# EasyEDA Pro project ProPrj_ROV_MINI_CTRL_2026-11-13.epro, board ROV_MINI_CTRL_V1.0.0
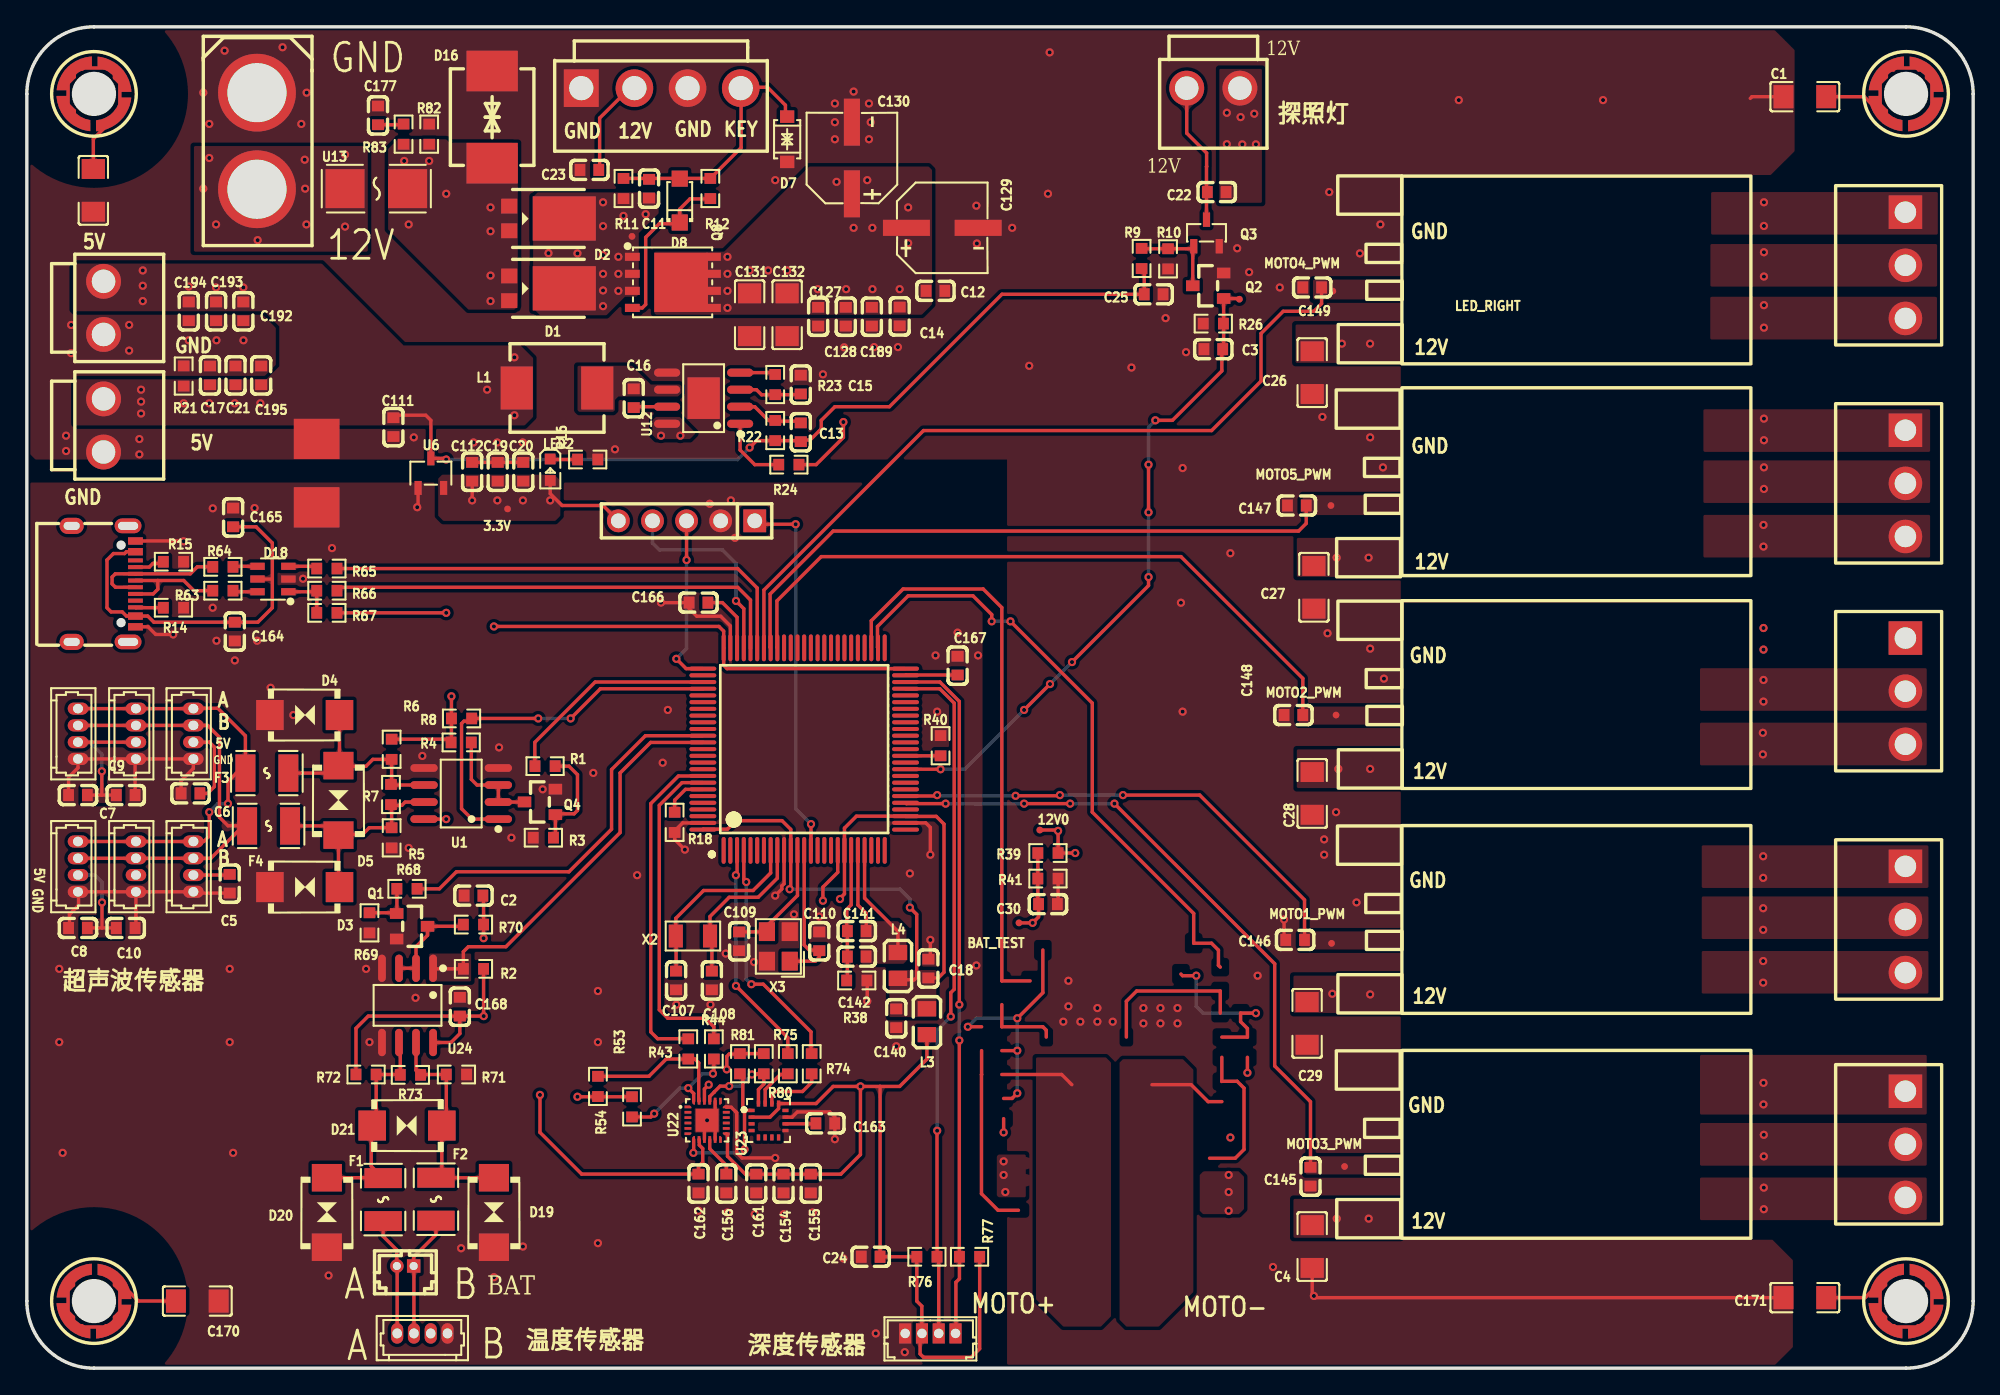
[diagram p12: board, top side]
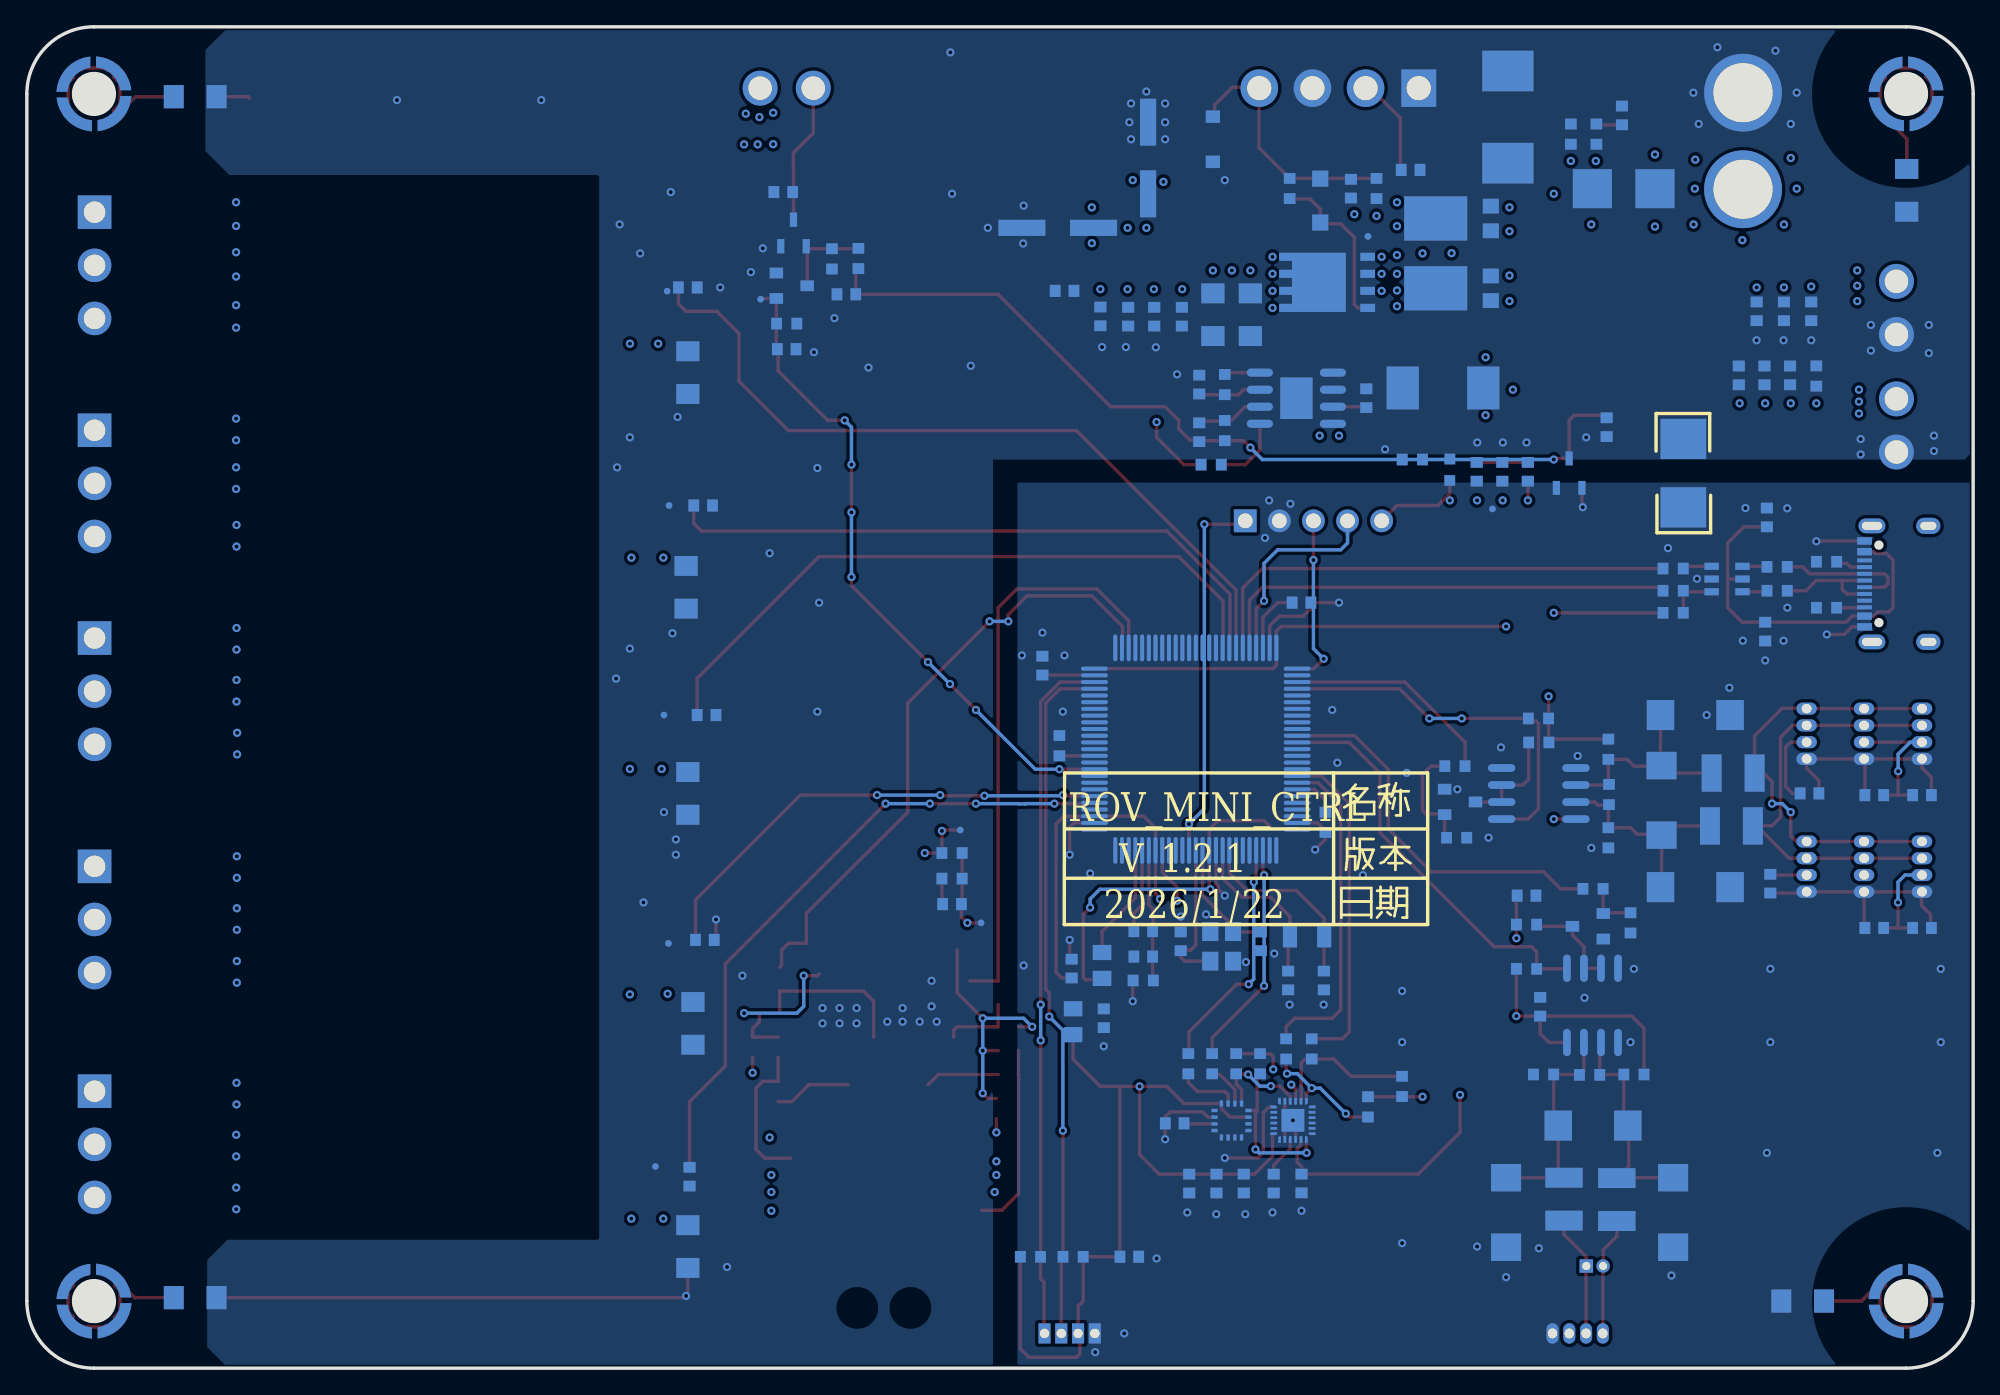
[diagram p13: board, bottom side, seen from below]

Outline 145 x 100 mm; copper layers: Top Layer, Inner1, Inner2, Bottom Layer. Coordinates in mm from the lower left corner of the outline.
Outline path: 0,95 0,5 arc(1.46,1.46) 5,0 140,0 arc(143.54,1.46) 145,5 145,95 arc(143.54,98.54) 140,100 5,100 arc(1.46,98.54) 0,95
Stack: Top Layer 0.035mm 外层铜厚1oz / Dielectric1 0.2104mm 7628 RC49% 8.6mil / Inner1 0.0152mm 内层铜厚 / Dielectric2 1.065mm 1.1mm H/HOZ Copper / Inner2 0.0152mm 内层铜厚 / Dielectric3 0.2104mm 7628 RC49% 8.6mil / Bottom Layer 0.035mm 外层铜厚1oz

## Design rules (mm)
spacing copperThickness1oz (default): track to track 0.102, other pairs 0.152 to 0.3
spacing copperThickness2oz: track to track 0.203, other pairs 0.152 to 0.3
spacing Plane_innerPlane: track to track 0.102, other pairs 0.152 to 0.3
spacing Copper_copperRegion: track to track 0.102, other pairs 0.152 to 0.3
track width copperThickness1oz (default): min 0.127, default 0.254, max 2.54
track width copperThickness2oz: min 0.203, default 0.254, max 2.54
differential pair differentialPair (default): width min 0.127, default 0.254, max 2.54; gap min 0.152, default 0.152
net class GND uses Copper_copperRegion, Plane_innerPlane
net 3V3 uses Copper_copperRegion, Plane_innerPlane
net 5V0 uses Copper_copperRegion, Plane_innerPlane
net 12V0_IN uses Copper_copperRegion, Plane_innerPlane
net GND uses Copper_copperRegion, Plane_innerPlane
net 3V3_MCU uses Copper_copperRegion, Plane_innerPlane
net $3N697 uses Copper_copperRegion, Plane_innerPlane
net $3N698 uses Copper_copperRegion, Plane_innerPlane
net $3N900 uses Copper_copperRegion, Plane_innerPlane
net $3N913 uses Copper_copperRegion, Plane_innerPlane
net MOTO1_PWM_TIM3_CH1 uses Copper_copperRegion, Plane_innerPlane
net MOTO3_PWM_TIM2_CH1 uses Copper_copperRegion, Plane_innerPlane
net NRST uses Copper_copperRegion, Plane_innerPlane
net SWCLK uses Copper_copperRegion, Plane_innerPlane
net SWDIO uses Copper_copperRegion, Plane_innerPlane
net PB5 uses Copper_copperRegion, Plane_innerPlane
net $3N1102 uses Copper_copperRegion, Plane_innerPlane
net IMU_I2C1_SCL uses Copper_copperRegion, Plane_innerPlane
net IMU_I2C1_SDA uses Copper_copperRegion, Plane_innerPlane
net VDDA uses Copper_copperRegion, Plane_innerPlane
net $3N27755 uses Copper_copperRegion, Plane_innerPlane
net $3N37958 uses Copper_copperRegion, Plane_innerPlane
net $3N37962 uses Copper_copperRegion, Plane_innerPlane
net PD6_UART2_RX_BAT uses Copper_copperRegion, Plane_innerPlane
net PD5_UART2_TX_BAT uses Copper_copperRegion, Plane_innerPlane
net $3N43765 uses Copper_copperRegion, Plane_innerPlane
net OTG_FS_DP uses Copper_copperRegion, Plane_innerPlane
net OTG_FS_DM uses Copper_copperRegion, Plane_innerPlane
net MOTO5_PWM_TIM1_CH2 uses Copper_copperRegion, Plane_innerPlane
net MOTO2_PWM_TIM1_CH1 uses Copper_copperRegion, Plane_innerPlane
net RSTN uses Copper_copperRegion, Plane_innerPlane
net DRDY uses Copper_copperRegion, Plane_innerPlane
net $3N43824 uses Copper_copperRegion, Plane_innerPlane
net $3N37466 uses Copper_copperRegion, Plane_innerPlane
net $7N447 uses Copper_copperRegion, Plane_innerPlane
net $7N1099 uses Copper_copperRegion, Plane_innerPlane
net 5VUSB uses Copper_copperRegion, Plane_innerPlane
net BAT_A uses Copper_copperRegion, Plane_innerPlane
net BAT_B uses Copper_copperRegion, Plane_innerPlane
net $5N5769 uses Copper_copperRegion, Plane_innerPlane
net $5N5773 uses Copper_copperRegion, Plane_innerPlane
net $5N5566 uses Copper_copperRegion, Plane_innerPlane
net $5N5491 uses Copper_copperRegion, Plane_innerPlane
net $6N1333 uses Copper_copperRegion, Plane_innerPlane
net $6N1784 uses Copper_copperRegion, Plane_innerPlane
net $6N582 uses Copper_copperRegion, Plane_innerPlane
net $6N719 uses Copper_copperRegion, Plane_innerPlane
net $5N2875 uses Copper_copperRegion, Plane_innerPlane
net $5N2878 uses Copper_copperRegion, Plane_innerPlane
net $7N2109 uses Copper_copperRegion, Plane_innerPlane
net $7N2149 uses Copper_copperRegion, Plane_innerPlane
net AUX_DA uses Copper_copperRegion, Plane_innerPlane
net AUX_CL uses Copper_copperRegion, Plane_innerPlane
net $6N3154 uses Copper_copperRegion, Plane_innerPlane
net $6N3161 uses Copper_copperRegion, Plane_innerPlane
net $6N3166 uses Copper_copperRegion, Plane_innerPlane
net I2C2_SDA uses Copper_copperRegion, Plane_innerPlane
net I2C2_SCL uses Copper_copperRegion, Plane_innerPlane
net $8N1202 uses Copper_copperRegion, Plane_innerPlane
net $8N1351 uses Copper_copperRegion, Plane_innerPlane
net $8N1499 uses Copper_copperRegion, Plane_innerPlane
net $8N1306 uses Copper_copperRegion, Plane_innerPlane
net $9N50407 uses copperRegion_copperThickness1oz
net $9N50406 uses copperRegion_copperThickness1oz
net 12V0 uses copperRegion_copperThickness1oz
net $9N50416 uses copperRegion_copperThickness1oz
pour e645 uses Copper_copperRegion, copperRegion_Copper_copperRegion
pour e647 uses Copper_copperRegion, copperRegion_Copper_copperRegion
pour e679 uses Copper_copperRegion, copperRegion_Copper_copperRegion
pour e681 uses Copper_copperRegion, copperRegion_Copper_copperRegion
pour e683 uses Copper_copperRegion, copperRegion_Copper_copperRegion
pour e685 uses Copper_copperRegion, copperRegion_Copper_copperRegion
pour e719 uses Copper_copperRegion, copperRegion_Copper_copperRegion
pour e721 uses Copper_copperRegion, copperRegion_Copper_copperRegion
pour e723 uses Copper_copperRegion, copperRegion_Copper_copperRegion
pour e725 uses Copper_copperRegion, copperRegion_Copper_copperRegion
pour e727 uses Copper_copperRegion, copperRegion_Copper_copperRegion
pour e729 uses Copper_copperRegion, copperRegion_Copper_copperRegion
pour e733 uses Copper_copperRegion, copperRegion_Copper_copperRegion
net MOTO+ uses copperRegion_copperThickness1oz
net MOTO- uses copperRegion_copperThickness1oz
pour e1003 uses Copper_copperRegion, copperRegion_Copper_copperRegion
pour e1011 uses Copper_copperRegion, copperRegion_Copper_copperRegion
pour e1151 uses Copper_copperRegion, copperRegion_Copper_copperRegion
net SENSOR_B uses copperRegion_copperThickness1oz
pour e1418 uses Copper_copperRegion, copperRegion_Copper_copperRegion
pour e1420 uses Copper_copperRegion, copperRegion_Copper_copperRegion
pour e1596 uses Copper_copperRegion, copperRegion_Copper_copperRegion
pour e1953 uses Copper_copperRegion, copperRegion_Copper_copperRegion
pour e1981 uses Copper_copperRegion, copperRegion_Copper_copperRegion
pour e2005 uses Copper_copperRegion, copperRegion_Copper_copperRegion
pour e2120 uses Copper_copperRegion, copperRegion_Copper_copperRegion
pour e2124 uses Copper_copperRegion, copperRegion_Copper_copperRegion
pour e2153 uses Copper_copperRegion, copperRegion_Copper_copperRegion
pour e2157 uses Copper_copperRegion, copperRegion_Copper_copperRegion
pour e2159 uses Copper_copperRegion, copperRegion_Copper_copperRegion
pour e2161 uses Copper_copperRegion, copperRegion_Copper_copperRegion
pour e2189 uses Copper_copperRegion, copperRegion_Copper_copperRegion
pour e2218 uses Copper_copperRegion, copperRegion_Copper_copperRegion

## Placement (name value [footprint] x y rotation side)
3.3V  -  [Test-Point-0.5mm]  35.81 64.06 270 top
12V0  -  [Test-Point-0.5mm]  75.46 40.12 0 top
12V0_IN  -  [Test-Point-0.5mm]  45.08 84.38 0 top
BAT_TEST  -  [Test-Point-0.5mm]  73.91 33.2 0 top
C1  1nF  [C1206]  132.46 94.79 0 top
C2  100nF  [C0603]  33.27 35.23 0 top
C3  100nF  [C0603]  88.39 75.97 0 top
C4  22uF  [C1206]  95.76 9.07 90 top
C5  100nF  [C0603]  15.11 36.12 90 top
C6  100nF  [C0603]  12.19 42.85 0 top
C7  100nF  [C0603]  3.81 42.72 0 top
C8  100nF  [C0603]  3.81 32.82 0 top
C9  100nF  [C0603]  7.37 42.72 180 top
C10  100nF  [C0603]  7.37 32.82 180 top
C11  100nF  [C0603]  46.36 87.94 270 top
C12  10uF  [C0603]  67.69 80.31 180 top
C13  20pF  [C0603]  57.66 69.77 270 top
C14  100nF  [C0603]  65.02 78.41 90 top
C15  0.47uF  [C0603]  57.66 73.33 90 top
C16  100nF  [C0603]  45.21 72.31 270 top
C17  22uF  [C0603]  13.64 74.01 90 top
C18  100nF  [C0603]  67.16 29.79 270 top
C19  22uF  [C0603]  35.08 66.83 90 top
C20  100nF  [C0603]  36.98 66.83 90 top
C21  22uF  [C0603]  15.55 74.01 90 top
C22  100nF  [C0603]  88.65 87.68 0 top
C23  100nF  [C0603]  41.91 89.33 0 top
C24  100nF  [C0603]  62.87 8.31 0 top
C25  100nF  [C0603]  83.95 80.06 180 top
C26  22uF  [C1206]  95.76 74.22 90 top
C27  22uF  [C1206]  95.88 58.22 90 top
C28  22uF  [C1206]  95.76 42.85 90 top
C29  22uF  [C1206]  95.38 25.71 90 top
C30  100nF  [C0603]  76.07 34.59 180 top
C107  12pF  [C0603]  48.37 28.9 270 top
C108  12pF  [C0603]  51.03 28.9 270 top
C109  20pF  [C0603]  53.07 31.82 90 top
C110  20pF  [C0603]  59.04 31.82 270 top
C111  1uF  [C0603]  27.31 70.16 90 top
C112  1uF  [C0603]  33.17 66.83 270 top
C127  100nF  [C0603]  58.95 78.39 90 top
C128  100nF  [C0603]  61.01 78.39 90 top
C129  220uF  [CAP-SMD_BD6.3-L6.6-W6.6-LS7.2-FD]  68.2 85.01 0 top
C130  220uF  [CAP-SMD_BD6.3-L6.6-W6.6-LS7.2-FD]  61.47 90.22 90 top
C131  22uF  [C1206]  53.85 78.54 90 top
C132  22uF  [C1206]  56.64 78.54 90 top
C140  100nF  [C0603]  64.77 26.09 90 top
C141  100nF  [C0603]  61.83 32.59 0 top
C142  10uF  [C0603]  61.83 30.68 0 top
C145  100nF  [C0603]  95.63 14.28 90 top
C146  100nF  [C0603]  94.49 31.93 0 top
C147  100nF  [C0603]  94.62 64.31 0 top
C148  100nF  [C0603]  94.36 48.69 0 top
C149  100nF  [C0603]  95.76 80.57 0 top
C154  10nF  [C0603]  56.37 13.76 90 top
C155  100nF  [C0603]  58.4 13.76 90 top
C156  100nF  [C0603]  52.11 13.76 90 top
C161  100nF  [C0603]  54.34 13.76 90 top
C162  100nF  [C0603]  50.04 13.77 90 top
C163  4.7uF  [C0603]  59.49 18.25 180 top
C164  100nF  [C0603]  15.49 54.92 90 top
C165  10uF  [C0603]  15.37 63.42 270 top
C166  2.2uF  [C0603]  50.04 57.07 180 top
C167  2.2uF  [C0603]  69.34 52.38 90 top
C168  100nF  [C0603]  32.26 26.95 270 top
C169  1nF  [C1206]  4.95 87.81 90 top
C170  1nF  [C1206]  12.7 5 180 top
C171  1nF  [C1206]  132.46 5.26 0 top
C177  220nF  [C0603]  26.16 93.4 270 top
C189  10uF  [C0603]  62.95 78.39 90 top
C192  10uF  [C0603]  16.13 78.79 90 top
C193  100nF  [C0603]  14.1 78.79 270 top
C194  10uF  [C0603]  12.06 78.79 90 top
C195  100nF  [C0603]  17.46 74.01 90 top
CN3  VH3.96-2P ZZ  [CONN-TH_2P-P3.96_C9900035759]  88.39 95.43 0 top
CN12  WAFER-MX1.25-2PZZ  [CONN-TH_2P-P1.25-V-M_721]  28.19 7.62 0 top
CN22  VH3.96-2P ZZ  [CONN-TH_2P-P3.96_C9900035759]  5.72 70.28 90 top
CN23  VH3.96-2P ZZ  [CONN-TH_2P-P3.96_C9900035759]  5.72 79.05 90 top
D1  SB1045L  [TO-277_3P-L5.4-W4.0-LS6.5-TR]  37.99 80.51 180 top
D2  SB1045L  [TO-277_3P-L5.4-W4.0-LS6.5-TR]  37.99 85.71 180 top
D3  P6SMB6.8CA  [SMB_L4.3-W3.6-LS5.4-BI]  20.7 35.86 180 top
D4  P6SMB6.8CA  [SMB_L4.3-W3.6-LS5.4-BI]  20.7 48.69 180 top
D5  P6SMB6.8CA  [SMB_L4.3-W3.6-LS5.4-BI]  23.22 42.33 270 top
D7  SJD12C12L01  [SOD-123_L2.8-W1.8-LS3.7-BI]  56.64 91.62 270 top
D8  DSK24  [SOD-123FL_L2.7-W1.8-LS3.8-RD]  48.64 87.05 90 top
D16  5.0SMDJ15CA  [SMC_L6.9-W5.9-LS7.9-BI]  34.66 93.27 270 top
D18  USBLC6-2SC6  [SOT-23-6_L2.9-W1.6-P0.95-LS2.8-BL]  18.34 58.83 90 top
D19  P6SMB6.8CA  [SMB_L4.3-W3.6-LS5.4-BI]  34.8 11.61 270 top
D20  P6SMB6.8CA  [SMB_L4.3-W3.6-LS5.4-BI]  22.35 11.61 270 top
D21  P6SMB6.8CA  [SMB_L4.3-W3.6-LS5.4-BI]  28.32 18.09 0 top
F1  MF-USMF010-2  [F1210]  26.54 12.57 270 top
F2  MF-USMF010-2  [F1210]  30.48 12.6 270 top
F3  MF-USMF010-2  [F1210]  17.88 44.36 180 top
F4  MF-USMF010-2  [F1210]  18.01 40.43 180 top
H1  PZ254V-11-05P  [HDR-TH_5P-P2.54-V-M]  49.15 63.17 180 top
L1  3.3uH  [IND-SMD_L7.0-W6.6]  39.5 73.08 0 top
L3  CBW201209U301T  [L0805]  67.06 25.83 90 top
L4  CBW201209U301T  [L0805]  64.9 30.02 90 top
LED2  XL-1608SURC-06  [LED0603-RD_RED]  38.99 66.98 270 top
LED_RIGHT  -  [Test-Point-0.5mm]  90.34 79.69 0 top
MOTO1_PWM  -  [Test-Point-0.5mm]  97.2 31.67 0 top
MOTO2_PWM  -  [Test-Point-0.5mm]  97.54 48.69 0 top
MOTO3_PWM  -  [Test-Point-0.5mm]  98.17 15.04 0 top
MOTO4_PWM  -  [Test-Point-0.5mm]  97.3 80.3 90 top
MOTO5_PWM  -  [Test-Point-0.5mm]  97.16 64.31 0 top
Q1  SS8050  [SOT-23_L2.9-W1.3-P1.90-LS2.4-BR]  28.7 32.94 180 top
Q2  SS8050  [SOT-23_L2.9-W1.3-P1.90-LS2.4-BR]  88.01 80.7 0 top
Q3  HL2312  [SOT-23-3_L2.9-W1.3-P1.90-LS2.3-BR]  87.88 84.63 270 top
Q4  SS8050  [SOT-23_L2.9-W1.3-P1.90-LS2.4-BR]  38.23 42.22 0 top
Q8  XR60P03F  [DFN5X6-8_L5.9-W5.2-P1.27-LS6.2-BL-EP]  48.13 80.95 270 top
R1  1kΩ  [R0603]  38.61 44.88 0 top
R2  4.7kΩ  [R0603]  33.27 29.77 0 top
R3  4.7kΩ  [R0603]  38.48 39.55 0 top
R4  4.7kΩ  [R0603]  32.36 46.65 0 top
R5  4.7kΩ  [R0603]  27.18 39.54 270 top
R6  4.7kΩ  [R0603]  27.18 46.14 90 top
R7  120Ω  [R0603]  27.13 42.77 270 top
R8  10kΩ  [R0603]  32.39 48.44 180 top
R9  10K  [R0603]  83.05 82.73 270 top
R10  100K  [R0603]  85.02 82.7 270 top
R11  47K  [R0603]  44.45 87.95 270 top
R12  3R3  [R0603]  50.92 87.95 270 top
R14  5.1kΩ  [R0603]  10.92 56.69 180 top
R15  5.1kΩ  [R0603]  10.92 60.12 180 top
R16  1kΩ  [R0603]  41.78 67.74 180 top
R18  4.7kΩ  [R0603]  48.26 40.69 90 top
R21  49.9K  [R0603]  11.68 73.97 270 top
R22  365k  [R0603]  55.75 69.9 90 top
R23  100k  [R0603]  55.75 73.33 90 top
R24  10k  [R0603]  56.77 67.36 0 top
R26  10K  [R0603]  88.39 77.88 0 top
R37  0Ω  [RES-SMD_L6.4-W3.2-A]  21.59 66.73 270 bottom
R38  0Ω  [R0603]  61.83 28.9 180 top
R39  100K  [R0603]  76.07 38.41 0 top
R40  4.7kΩ  [R0603]  68.07 46.41 270 top
R41  27k  [R0603]  76.07 36.5 180 top
R43  22Ω  [R0603]  49.28 23.8 270 top
R44  22Ω  [R0603]  51.18 23.8 270 top
R53  10kΩ  [R0603]  45.08 19.48 90 top
R54  10kΩ  [R0603]  42.55 21.01 270 top
R63  33Ω  [R0603]  14.61 57.96 180 top
R64  33Ω  [R0603]  14.61 59.74 0 top
R65  33Ω  [R0603]  22.35 59.61 180 top
R66  33Ω  [R0603]  22.35 57.96 180 top
R67  10kΩ  [R0603]  22.35 56.31 0 top
R68  1kΩ  [R0603]  28.32 35.74 180 top
R69  4.7kΩ  [R0603]  25.53 33.2 90 top
R70  4.7kΩ  [R0603]  33.27 33.07 180 top
R71  4.7kΩ  [R0603]  32 21.9 0 top
R72  4.7kΩ  [R0603]  25.27 21.9 180 top
R73  120Ω  [R0603]  28.58 21.87 0 top
R74  0Ω  [R0603]  58.47 22.7 90 top
R75  0Ω  [R0603]  56.69 22.7 90 top
R76  10kΩ  [R0603]  67.06 8.31 180 top
R77  10kΩ  [R0603]  70.23 8.31 0 top
R80  10kΩ  [R0603]  54.9 22.7 90 top
R81  10kΩ  [R0603]  53.13 22.7 90 top
R82  649kΩ  [R0603]  29.97 92 270 top
R83  3.3Ω  [R0603]  28.07 92 270 top
U1  MAX3485ESA(UMW)  [SOP-8_L5.0-W4.0-P1.27-LS6.0-BL]  32.36 42.84 90 top
U2  XT60-M.  [CONN-TH_XT60]  17.14 91.49 270 top
U3  WAFER-MX1.25-4PZZ  [CONN-TH_4P-P1.25_WAFER-MX1.25-4PZZ]  67.31 2.59 0 top
U4  ZX-MX1.25-4PZZ  [CONN-TH_4P-P1.25_MEGASTAR_ZX-MX1.25-4PZZ]  29.46 2.59 0 top
U5  ZX-MX1.25-4PZZ  [CONN-TH_4P-P1.25_MEGASTAR_ZX-MX1.25-4PZZ]  3.81 47.3 270 top
U6  XC6206P332MR  [SOT-23-3_L3.0-W1.7-P0.95-LS2.9-BR]  30.1 66.73 270 top
U7  ZX-MX1.25-4PZZ  [CONN-TH_4P-P1.25_MEGASTAR_ZX-MX1.25-4PZZ]  3.81 37.39 270 top
U8  ZX-MX1.25-4PZZ  [CONN-TH_4P-P1.25_MEGASTAR_ZX-MX1.25-4PZZ]  8.13 37.39 270 top
U9  ZX-MX1.25-4PZZ  [CONN-TH_4P-P1.25_MEGASTAR_ZX-MX1.25-4PZZ]  12.41 37.39 270 top
U10  ZX-MX1.25-4PZZ  [CONN-TH_4P-P1.25_MEGASTAR_ZX-MX1.25-4PZZ]  8.13 47.3 270 top
U11  ZX-MX1.25-4PZZ  [CONN-TH_4P-P1.25_MEGASTAR_ZX-MX1.25-4PZZ]  12.41 47.3 270 top
U12  TPS56528DDAR  [SOIC-8_L4.9-W3.9-P1.27-LS6.0-BL-EP]  50.42 72.31 90 top
U13  0451010.MRL  [FUSE-SMD_L6.1-W2.7]  26.03 87.94 0 top
U14  XY-VH3.96-3A11  [CONN-TH_3P-P3.96_XYECONN_XY-VH3.96-3A11]  139.95 82.22 270 top
U15  XY-VH3.96-3A11  [CONN-TH_3P-P3.96_XYECONN_XY-VH3.96-3A11]  139.95 65.96 270 top
U16  XY-VH3.96-3A11  [CONN-TH_3P-P3.96_XYECONN_XY-VH3.96-3A11]  139.95 50.47 270 top
U17  XY-VH3.96-3A11  [CONN-TH_3P-P3.96_XYECONN_XY-VH3.96-3A11]  139.95 33.45 270 top
U18  XY-VH3.96-3A11  [CONN-TH_3P-P3.96_XYECONN_XY-VH3.96-3A11]  139.95 16.69 270 top
U19  STM32F407VET6  [LQFP-100_L14.0-W14.0-P0.50-LS16.0-BL]  57.91 46.15 0 top
U20  VH3.96-4P ZZ  [CONN-TH_4P-P3.96_HX-VH3.96-4P-ZZ]  47.24 95.43 0 top
U22  MPU-6500  [QFN-24_L3.0-W3.0-P0.40-BL-EP]  50.68 18.48 270 top
U23  IST8310  [LGA-16_L3.0-W3.0-P0.50-BL_SQ]  55.25 18.46 270 top
U24  MAX3485ESA(UMW)  [SOP-8_L5.0-W4.0-P1.27-LS6.0-BL]  28.36 27.05 180 top
U25  R30-1000602-Harwin  [SMD_BD5.0-D3.0]  5 95 0 top
U26  R30-1000602-Harwin  [SMD_BD5.0-D3.0]  5 5 0 top
U27  R30-1000602-Harwin  [SMD_BD5.0-D3.0]  140 5 0 top
U28  R30-1000602-Harwin  [SMD_BD5.0-D3.0]  140 95 0 top
USB1  TYPE-C 16PIN 2MD(073)  [USB-C-SMD_TYPE-C-6PIN-2MD-073]  5.72 58.47 270 top
X2  32.768kHz  [CRYSTAL-SMD_L3.2-W1.5-1]  49.62 32.22 180 top
X3  8MHz  [CRYSTAL-SMD_4P-L3.2-W2.5-BL]  55.99 31.44 90 top

## Footprints (pads in the part's own frame, mm; a bottom-side part is the same pattern mirrored in y, then rotated)
C0603
  rect 0.8x0.9 hole 0.001: 1(-0.7,0) 2(0.7,0)
C1206
  rect 1.485x1.728 hole 0.001: 1(-1.593,0) 2(1.593,0)
CAP-SMD_BD6.3-L6.6-W6.6-LS7.2-FD
  rect 3.5x1.2 hole 0.001: 1(-2.67,0) 2(2.67,0)
CONN-TH_2P-P1.25-V-M_721
  rect 1x1 hole 0.6: 1(0.625,0)
  round 1 hole 0.6: 2(-0.625,0)
CONN-TH_2P-P3.96_C9900035759
  round 2.6 hole 1.75: 1(-1.98,0) 2(1.98,0)
CONN-TH_3P-P3.96_XYECONN_XY-VH3.96-3A11
  rect 2.5x2.5 hole 1.6: 1(-3.96,0)
  round 2.5 hole 1.6: 2(0,0) 3(3.96,0)
CONN-TH_4P-P1.25_MEGASTAR_ZX-MX1.25-4PZZ
  oval 0.9x1.524 hole 0.7x0.735: 1(-1.875,0) 2(-0.625,0) 3(0.625,0) 4(1.875,0)
CONN-TH_4P-P1.25_WAFER-MX1.25-4PZZ
  rect 0.9x1.5 hole 0.7: 1(1.875,0) 2(0.625,0) 3(-0.625,0) 4(-1.875,0)
CONN-TH_4P-P3.96_HX-VH3.96-4P-ZZ
  rect 2.6x2.8 hole 1.8: 1(-5.94,0)
  round 2.8 hole 1.8: 2(-1.98,0) 3(1.98,0) 4(5.94,0)
CONN-TH_XT60
  round 5.8 hole 4.4: 1(-3.6,0) 2(3.6,0)
CRYSTAL-SMD_4P-L3.2-W2.5-BL
  rect 1.4x1.2 hole 0.001: 1(-1.1,-0.85) 2(1.1,-0.85) 3(1.1,0.85) 4(-1.1,0.85)
CRYSTAL-SMD_L3.2-W1.5-1
  rect 1.05x1.7 hole 0.001: 1(-1.275,0) 2(1.275,0)
DFN5X6-8_L5.9-W5.2-P1.27-LS6.2-BL-EP
  rect 0.6x1.1 hole 0.001: 1(-1.905,-3.025) 2(-0.635,-3.025) 3(0.635,-3.025) 4(1.905,-3.025) 5(1.905,3.025) 6(0.635,3.025) 7(-0.635,3.025) 8(-1.905,3.025)
  rect 4.41x4 hole 0.001: 9(0,0.61)
F1210
  rect 1.485x2.781 hole 0.001: 1(-1.6,0) 2(1.6,0)
FUSE-SMD_L6.1-W2.7
  rect 2.91x2.905 hole 0.001: 1(-2.33,0) 2(2.33,0)
HDR-TH_5P-P2.54-V-M
  rect 1.7x1.7 hole 1.1: 1(-5.08,0)
  round 1.7 hole 1.1: 2(-2.54,0) 3(0,0) 4(2.54,0) 5(5.08,0)
IND-SMD_L7.0-W6.6
  rect 2.4x3.2 hole 0.001: 1(-3,0) 2(3,0)
L0805
  rect 1.133x1.377 hole 0.001: 1(-0.966,0) 2(0.966,0)
LED0603-RD_RED
  rect 0.8x0.8 hole 0.001: 1(-0.799,-0.004) 2(0.799,0.004)
LGA-16_L3.0-W3.0-P0.50-BL_SQ
  rect 0.25x0.45 hole 0.001: 1(-0.75,-1.263) 2(-0.25,-1.263) 3(0.25,-1.263) 4(0.75,-1.263) 9(0.75,1.263) 10(0.25,1.263) 11(-0.25,1.263) 12(-0.75,1.263)
  rect 0.45x0.25 hole 0.001: 5(1.263,-0.75) 6(1.263,-0.25) 7(1.263,0.25) 8(1.263,0.75) 13(-1.263,0.75) 14(-1.263,0.25) 15(-1.263,-0.25) 16(-1.263,-0.75)
LQFP-100_L14.0-W14.0-P0.50-LS16.0-BL
  oval 0.3x2 hole 0.001: 1(-6,-7.55) 2(-5.5,-7.55) 3(-5,-7.55) 4(-4.5,-7.55) 5(-4,-7.55) 6(-3.5,-7.55) 7(-3,-7.55) 8(-2.5,-7.55) 9(-2,-7.55) 10(-1.5,-7.55) 11(-1,-7.55) 12(-0.5,-7.55) 13(0,-7.55) 14(0.5,-7.55) 15(1,-7.55) 16(1.5,-7.55) 17(2,-7.55) 18(2.5,-7.55) 19(3,-7.55) 20(3.5,-7.55) 21(4,-7.55) 22(4.5,-7.55) 23(5,-7.55) 24(5.5,-7.55) 25(6,-7.55) 51(6,7.55) 52(5.5,7.55) 53(5,7.55) 54(4.5,7.55) 55(4,7.55) 56(3.5,7.55) 57(3,7.55) 58(2.5,7.55) 59(2,7.55) 60(1.5,7.55) 61(1,7.55) 62(0.5,7.55) 63(0,7.55) 64(-0.5,7.55) 65(-1,7.55) 66(-1.5,7.55) 67(-2,7.55) 68(-2.5,7.55) 69(-3,7.55) 70(-3.5,7.55) 71(-4,7.55) 72(-4.5,7.55) 73(-5,7.55) 74(-5.5,7.55) 75(-6,7.55)
  oval 2x0.3 hole 0.001: 26(7.55,-6) 27(7.55,-5.5) 28(7.55,-5) 29(7.55,-4.5) 30(7.55,-4) 31(7.55,-3.5) 32(7.55,-3) 33(7.55,-2.5) 34(7.55,-2) 35(7.55,-1.5) 36(7.55,-1) 37(7.55,-0.5) 38(7.55,0) 39(7.55,0.5) 40(7.55,1) 41(7.55,1.5) 42(7.55,2) 43(7.55,2.5) 44(7.55,3) 45(7.55,3.5) 46(7.55,4) 47(7.55,4.5) 48(7.55,5) 49(7.55,5.5) 50(7.55,6) 76(-7.55,6) 77(-7.55,5.5) 78(-7.55,5) 79(-7.55,4.5) 80(-7.55,4) 81(-7.55,3.5) 82(-7.55,3) 83(-7.55,2.5) 84(-7.55,2) 85(-7.55,1.5) 86(-7.55,1) 87(-7.55,0.5) 88(-7.55,0) 89(-7.55,-0.5) 90(-7.55,-1) 91(-7.55,-1.5) 92(-7.55,-2) 93(-7.55,-2.5) 94(-7.55,-3) 95(-7.55,-3.5) 96(-7.55,-4) 97(-7.55,-4.5) 98(-7.55,-5) 99(-7.55,-5.5) 100(-7.55,-6)
QFN-24_L3.0-W3.0-P0.40-BL-EP
  custom 0.2x0.506 hole 0.001: 1(-1,-1.427) 6(1,-1.427) 13(1,1.427) 18(-1,1.427)
  rect 0.2x0.505 hole 0.001: 2(-0.6,-1.427) 3(-0.2,-1.427) 4(0.2,-1.427) 5(0.6,-1.427) 14(0.6,1.427) 15(0.2,1.427) 16(-0.2,1.427) 17(-0.6,1.427)
  custom 0.506x0.2 hole 0.001: 7(1.427,-1) 12(1.427,1) 19(-1.427,1) 24(-1.427,-1)
  rect 0.505x0.2 hole 0.001: 8(1.427,-0.6) 9(1.427,-0.2) 10(1.427,0.2) 11(1.427,0.6) 20(-1.427,0.6) 21(-1.427,0.2) 22(-1.427,-0.2) 23(-1.427,-0.6)
  rect 1.7x1.7 hole 0.001: 25(0,0)
R0603
  rect 0.806x0.864 hole 0.001: 1(-0.753,0) 2(0.753,0)
RES-SMD_L6.4-W3.2-A
  rect 3x3.4 hole 0.001: 1(-2.55,0) 2(2.55,0)
SMB_L4.3-W3.6-LS5.4-BI
  rect 2.047x2.241 hole 0.001: 1(-2.591,0) 2(2.591,0)
SMC_L6.9-W5.9-LS7.9-BI
  rect 3.03x3.82 hole 0.001: 1(-3.435,0) 2(3.435,0)
SMD_BD5.0-D3.0
  custom 2.52x2.628 hole 0.001: 1(-1.529,-1.792) 1(1.529,1.792)
  custom 2.629x2.52 hole 0.001: 1(-1.466,1.847) 1(1.465,-1.847)
SOD-123_L2.8-W1.8-LS3.7-BI
  rect 0.93x1.06 hole 0.001: 1(1.685,0) 2(-1.685,0)
SOD-123FL_L2.7-W1.8-LS3.8-RD
  rect 1.2x1.2 hole 0.001: 1(-1.635,0) 2(1.635,0)
SOIC-8_L4.9-W3.9-P1.27-LS6.0-BL-EP
  oval 0.602x1.941 hole 0.001: 1(-1.905,-2.72) 2(-0.635,-2.72) 3(0.635,-2.72) 4(1.905,-2.72) 5(1.905,2.72) 6(0.635,2.72) 7(-0.635,2.72) 8(-1.905,2.72)
  rect 3.098x2.41 hole 0.001: 9(0,0)
SOP-8_L5.0-W4.0-P1.27-LS6.0-BL
  oval 0.574x2.035 hole 0.001: 1(-1.905,-2.768) 2(-0.635,-2.768) 3(0.635,-2.768) 4(1.905,-2.768) 5(1.905,2.768) 6(0.635,2.768) 7(-0.635,2.768) 8(-1.905,2.768)
SOT-23-3_L2.9-W1.3-P1.90-LS2.3-BR
  rect 1.07x0.532 hole 0.001: 1(0.99,-0.95) 2(0.99,0.95) 3(-0.99,0)
SOT-23-3_L3.0-W1.7-P0.95-LS2.9-BR
  rect 1.038x0.532 hole 0.001: 1(1.101,-0.95) 2(1.101,0.95) 3(-1.101,0)
SOT-23-6_L2.9-W1.6-P0.95-LS2.8-BL
  rect 0.532x1.072 hole 0.001: 1(-0.95,-1.149) 2(0,-1.149) 3(0.95,-1.149) 4(0.95,1.149) 5(0,1.149) 6(-0.95,1.149)
SOT-23_L2.9-W1.3-P1.90-LS2.4-BR
  rect 1x0.8 hole 0.001: 1(1.15,-0.95) 2(1.15,0.95) 3(-1.15,0)
Test-Point-0.5mm
  round 0.5 hole 0.001: 1(0,0)
TO-277_3P-L5.4-W4.0-LS6.5-TR
  rect 1.2x1.1 hole 0.001: 1(2.054,0.92) 3(2.054,-0.92)
  rect 4.7x3.3 hole 0.001: 2(-2.054,0)
USB-C-SMD_TYPE-C-6PIN-2MD-073
  rect 0.55x1.1 hole 0.001: 1(-3.2,2.375) 2(-2.4,2.375) 11(2.4,2.375) 12(3.2,2.375)
  rect 0.3x1.1 hole 0.001: 3(-1.75,2.375) 4(-1.25,2.375) 5(-0.75,2.375) 6(-0.25,2.375) 7(0.25,2.375) 8(0.75,2.375) 9(1.25,2.375) 10(1.75,2.375)
  oval 1.1x2 hole 0.6x1.5: 13(-4.325,1.825) 14(4.325,1.825)
  oval 1.2x1.8 hole 0.6x1.2: 13(-4.325,-2.375) 14(4.325,-2.375)

## Nets
As in the schematic.

Pads without a net: U19 1 2 5 6 7 15 16 17 23 24 25 26 29 32 33 34 38 39 40 41 42 43 44 45 46 51 54 55 56 57 58 59 60 61 62 63 64 65 66 77 80 81 82 83 84 85 88 89 90 91 95 96 97 98; U22 1 2 3 4 5 6 14 15 16 17 19; U23 3 4 5 6 7 8 12; USB1 3 9 13 14

## Via types
v1: diameter 0.61, hole 0.305, Top Layer to Bottom Layer, 348 vias

## Routing (per net, layer and track width the routed paths; a pad name or vN(x,y) marks a point on that pad's centre or on a via; arc(x,y) is an arc through that point)
3V3: length 180.3
  Top Layer w0.254: v1(50.8,21.13) 50.48,20.81 U22.22 ; C2.2 34.03,35.18 R70.1 v1(34.03,32.06) ; U24.8 31.59,24.28 32.26,24.94 C168.2 ; C168.2 v1(34.04,26.25) 34.03,26.26 R2.2 ; C168.2 25.44,26.25 24.52,25.33 R72.2 ; v1(31.63,50.09) R8.2 31.63,46.67 R4.1 31.36,46.89 R6.2 ; 63.56,21.01 v1(62.1,21.01) ; 63.56,21.01 65.02,21.01 67.06,23.04 L3.1 ; 63.56,21.01 C24.2 66.18,8.31 ; v1(62.1,21.01) 62.1,15.93 60.64,14.47 53.53,14.47 52.2,15.8 52.2,17.39 U22.13 ; v1(62.1,21.01) 60.07,21.01 58.79,19.73 U23.13 56,19.35 55.37,18.71 U23.2 ; v1(38.23,20.37) 38.23,17.58 41.34,14.47 50.04,14.47 50.04,15.04 50.35,15.35 50.35,16.38 50.1,16.63 50.1,17.03 U22.8 ; H1.5 42.93,64.31 39.88,64.31 38.99,65.2 LED2.2 ; U19.50 52.17,52.15 51.91,52.41 U19.75 51.91,54.95 51.56,55.3 v1(34.8,55.3) ; R77.2 70.98,1.45 70.35,0.81 66.8,0.81 66.55,1.07 66.55,2.45 U3.3 66.68,2.6 66.68,4.62 66.3,5 R76.2 ; U1.8 v1(31.24,40.93) ; v1(52.14,22.28) 52.14,23.24 52.32,23.42 53.09,23.42 R81.2 R80.2 ; R53.2 v1(41.02,20.24) ; C112.2 v1(33.17,64.69) ; R67.2 v1(31.24,56.31)
  vias: v1(35.05,64.69) v1(36.96,64.69) v1(38.99,64.69)
3V3_MCU: length 54.3
  Top Layer w0.254: 60.53,34.98 60.91,35.36 U19.19 60.91,40.26 61.8,41.15 U19.28 65.48,41.14 67.75,41.14 68.33,40.56 68.33,29.51 67.9,29.09 C18.2 ; L4.1 65,28.95 66.11,28.95 66.29,29.13 66.29,33.83 v1(65.79,34.34) ; v1(56.83,35.71) 56.91,35.79 U19.11 56.91,40.17 56.26,40.82 52.83,40.82 52.2,40.18 50.39,40.18 U19.100
  Bottom Layer w0.254: v1(65.79,34.34) 65.79,34.98 65.06,35.71 v1(56.83,35.71)
  vias: v1(60.58,34.98)
5V0: length 249.4
  Top Layer w0.254: v1(31.24,67.74) 31.16,67.83 U6.3 30.1,70.66 29.72,71.04 27.49,71.04 C111.2 ; C5.2 15.06,36.76 U9.3 ; 5.6,32.82 C10.2 ; 5.6,32.82 C8.2 ; 5.6,32.82 v1(5.6,34.72) ; C9.2 5.59,42.72 ; 5.59,42.72 v1(5.59,44.5) ; 5.59,42.72 C7.2 ; v1(53.85,68.63) 54.36,69.15 R22.1 57.6,69.15 57.66,69.2 58.35,69.2 59.18,70.03 59.18,70.66 60.2,71.68 64.26,71.68 72.64,80.06 C25.2 83.25,81.78 R9.2 ; U11.3 13.6,46.67 13.97,46.3 13.97,43.36 13.46,42.85 C6.2 ; U5.3 U10.3
  Inner2 w0.254: U7.3 U8.3 U9.3 12.93,37.28 13.02,37.28 19.27,43.54 19.27,48.93 19.69,49.35 19.62,71.58 ; U5.3 U10.3 U11.3 12.93,47.19 13.02,47.19 17.74,51.91 17.74,54.47 17.55,54.67 17.55,64.37 17.4,64.52 v1(17.4,71.93) ; U4.3 30.09,23.81 22.35,31.55 22.35,60.69 22.15,60.9 22.15,61.38 22.35,61.58 22.35,71.42
  Bottom Layer w0.254: v1(5.6,34.72) 5.6,36.24 5.07,36.76 U7.3 ; v1(53.85,68.63) 52.96,67.74 v1(31.24,67.74) ; v1(5.59,44.5) 5.59,45.77 4.69,46.67 U5.3
  vias: v1(8.51,72.95) v1(8.51,72.06) v1(8.51,71.17) v1(8.64,81.84) v1(8.64,80.7) v1(8.64,79.55) v1(11.68,71.93) v1(12.06,80.64) v1(13.59,71.93) v1(14.1,80.57) v1(15.49,71.93) v1(16.13,80.57) v1(34.29,72.95) v1(36.32,75.36) v1(36.32,71.04)
5VUSB: length 28.5
  Top Layer w0.254: 18.29,58.86 18.26,58.83 D18.5 ; 18.29,58.86 18.29,61.52 17.08,62.72 C165.2 ; 18.29,58.86 18.29,56.69 17.21,55.61 C164.2 9.46,55.61 9,56.07 USB1.11 7.42,56.07 7.11,56.38 6.28,56.38 5.97,56.69 5.97,60.25 6.45,60.73 7.28,60.73 7.42,60.87 USB1.2
12V0: length 47.7
  Top Layer w0.254: R24.2 58.8,67.36 60.83,69.39 v1(60.83,70.54) ; 72.77,18.6 v1(72.77,17.58) ; 90.93,23.17 v1(90.93,22.02) ; C23.2 42.67,89.39 42.67,93.19 44.91,95.43 U20.2 ; 12V0.1 76.76,40.12 v1(76.83,40.06) R39.2 v1(78.1,38.41)
  Inner2 w0.254: v1(53.85,81.84) 53.85,82.98 45.21,91.62 45.21,95.38 U20.2 ; v1(76.83,40.06) 88.14,40.06
  vias: v1(47.24,69.52) v1(48.69,69.52) v1(52.2,82.86) v1(52.2,81.58) v1(52.2,80.31) v1(52.2,79.05) v1(55.23,81.84) v1(56.64,81.84) v1(58.93,80.44) v1(60.32,88.44) v1(61.03,80.44) v1(61.59,85.01) v1(62.61,88.57) v1(62.99,85.01) v1(63,80.44) v1(65.02,80.44) v1(65.66,86.54) v1(65.66,83.87) v1(72.77,15.42) v1(72.77,14.4) v1(72.9,13.13) v1(89.4,93.59) v1(89.4,91.25) v1(89.53,14.4) v1(89.53,13.13) v1(89.53,11.74) v1(89.66,17.2) v1(90.42,93.27) v1(90.55,91.24) v1(91.44,93.52) v1(91.57,91.24) v1(97.26,27.91) v1(97.58,60.42) v1(97.59,11.15) v1(97.71,44.68) v1(97.97,76.38) v1(99.96,60.42) v1(99.97,11.15) v1(100.07,76.38) v1(100.07,44.68) v1(100.08,27.86)
12V0_IN:
  vias: v1(38.86,83.13) v1(41.02,83.11) v1(42.93,86.92) v1(42.93,85.14) v1(42.93,82.98) v1(42.93,81.58) v1(42.93,80.35) v1(42.93,79.17) v1(44.07,82.86) v1(44.07,81.58) v1(44.07,80.31) v1(44.45,85.9) v1(46.1,86.03)
GND: length 129.5
  Top Layer w0.254: C1.1 128.52,94.79 128.4,94.67 ; C112.1 C19.2 C20.2 ; U8.4 U7.4 3.85,35.47 3.85,34.51 3.17,33.83 3.17,32.88 C8.1 ; U8.4 U9.4 12.5,35.42 C5.1 ; U8.4 8.13,32.88 C10.1 ; U22.20 51.28,19.08 v1(50.68,18.48) ; v1(55.75,35.23) 56.24,35.72 56.24,35.95 56.41,36.12 U19.10 ; v1(10.9,54.7) 9.6,54.7 9.03,55.27 USB1.12 ; U19.27 66.97,40.65 67.31,40.31 v1(67.31,38.28) ; v1(29.08,64.19) 29.15,64.25 U6.1 ; U10.4 U5.4 3.81,44.75 3.11,44.06 C7.1 ; U10.4 U11.4 12.41,44.72 11.49,43.8 C6.1 ; U10.4 8.07,45.36 C9.1 ; U22.18 52.13,19.46 52.47,19.46 52.83,19.1 52.83,19.1 52.88,19.05 52.88,16.06 53.28,15.67 v1(55.75,15.67) ; U19.74 52.41,55.33 51.69,56.06 49.91,56.06 49.34,56.63 C166.2 v1(47.24,57.07) ; C171.1 96.01,5.26 v1(95.88,5.38) 95.76,5.51 C4.1 ; U22.9 50.48,18.28 v1(50.68,18.48) ; U19.99 48.86,40.65 48.26,40.06 R18.1 48.26,39.42 v1(49.02,38.66) ; C30.1 76.83,34.65 R41.1 ; USB1.1 11.66,61.67 v1(11.68,61.65) ; R38.1 62.61,28.88 v1(62.61,27.36) ; v1(50.68,18.48) 51.28,17.88 U22.11 ; v1(93.66,33.45) 93.66,32.06 C146.1 ; v1(60.2,17.07) 60.2,18.24 C163.1 60.19,18.73 59.82,19.1 57.4,19.1 57.02,18.71 U23.11 ; v1(67.31,31.93) 67.31,30.64 C18.1
  vias: v1(2.41,29.77) v1(2.41,24.31) v1(2.67,16.05) v1(2.92,69.52) v1(2.92,68.38) v1(3.3,77.78) v1(3.3,75.67) v1(7.62,77.78) v1(7.62,75.86) v1(8.38,69.27) v1(8.38,68.12) v1(12.06,76.63) v1(13.14,95.09) v1(13.59,92.76) v1(13.84,56.69) v1(13.85,64.1) v1(14.13,76.63) v1(14.13,54.23) v1(14.73,98.22) v1(15.11,29.77) v1(15.11,24.31) v1(15.37,16.05) v1(15.49,52.76) v1(16.14,76.63) v1(16.97,64.12) v1(17.16,54.23) v1(18.16,50.72) v1(19.05,98.48) v1(19.86,48.69) v1(20.45,92.76) v1(20.57,58.85) v1(20.84,95.09) v1(22.48,6.91) v1(22.73,61.14) v1(25.27,29.77) v1(25.53,24.31) v1(28.45,38.79) v1(28.83,69.39) v1(28.96,27.61) v1(29.46,45.64) v1(32.35,8.94) v1(33.27,69.01) v1(34.8,6.78) v1(35.04,69.01) v1(35.18,46.28) v1(36.1,39.55) v1(36.94,69.01) v1(36.96,9.07) v1(38.43,43.16) v1(42.2,44.38) v1(42.55,28.12) v1(42.55,24.31) v1(42.55,9.32) v1(43.81,68.5) v1(45.47,36.75) v1(47.37,45.14) v1(47.75,49.07) v1(48.39,27.1) v1(50.04,11.74) v1(50.87,64.44) v1(50.93,27.1) v1(52.07,30.91) v1(52.2,11.61) v1(52.45,64.69) v1(52.76,61.9) v1(54.18,30.28) v1(54.23,11.48) v1(55.75,88.57) v1(56.39,11.48) v1(57.15,33.83) v1(58.55,11.61) v1(59.04,33.67) v1(59.31,74.09) v1(60.2,94.28) v1(60.2,92.89) v1(60.2,91.62) v1(60.83,8.18) v1(60.89,76.11) v1(61.59,95.17) v1(62.74,94.28) v1(62.74,91.62) v1(62.87,92.89) v1(63.12,76.12) v1(63.25,2.59) v1(64.77,24) v1(64.9,76.12) v1(65.41,1.19) v1(65.79,36.88) v1(67.7,53.14) v1(67.82,48.95) v1(69.34,54.83) v1(70.74,86.67) v1(70.74,30.02) v1(70.78,83.85) v1(70.87,53.14) v1(73.41,85.01) v1(74.68,74.73) v1(76.07,87.55) v1(76.2,98.09) v1(77.22,25.83) v1(77.6,28.88) v1(77.6,26.97) v1(78.49,25.83) v1(79.76,26.85) v1(79.76,25.83) v1(80.9,25.83) v1(82.3,74.6) v1(83.19,26.85) v1(83.19,25.71) v1(84.46,26.85) v1(84.46,25.71) v1(84.84,78.28) v1(85.72,26.85) v1(85.72,25.71) v1(85.98,57.06) v1(86.11,67.11) v1(86.11,48.95) v1(86.36,75.74) v1(89.66,60.76) v1(90.17,83.49) v1(91.06,81.71) v1(91.69,29.26) v1(92.84,7.54) v1(93.34,80.57) v1(96.52,70.92) v1(96.65,39.42) v1(96.65,38.28) v1(96.9,54.79) v1(97.03,87.68) v1(97.54,41.45) v1(99.06,34.72) v1(99.31,83.11) v1(100.08,69.39) v1(100.08,53.64) v1(100.84,85.27) v1(101.03,67.15) v1(101.1,51.41) v1(106.68,94.54) v1(117.43,94.54)
V1:
  vias: v1(129.41,83.2) v1(129.41,81.38)
V2:
  vias: v1(129.38,51.31) v1(129.38,49.7)
V3:
  vias: v1(129.4,17.4) v1(129.4,15.79)
V4:
  vias: v1(129.41,67.16) v1(129.41,65.55)
V5:
  vias: v1(129.36,34.29) v1(129.36,32.68)
VDDA: length 14.9
  Top Layer w0.254: C141.2 62.53,33.91 61.91,34.53 U19.21 ; L4.2 64.9,32.56 62.41,35.05 U19.22
AUX_CL: length 11.4
  Top Layer w0.254: 53.34,19.16 53.39,19.21 U23.1 ; 53.34,19.16 53.47,19.04 v1(53.47,16.31) ; 53.34,19.16 53.34,21.73 53.13,21.94 ; v1(49.66,16.05) 49.68,16.07 U22.7
  Bottom Layer w0.254: v1(53.47,16.31) 53.21,16.05 v1(49.66,16.05)
AUX_DA: length 7.5
  Top Layer w0.254: U23.16 54.5,20.77 54.9,21.17 54.9,21.94 54.4,21.94 54.36,21.9 v1(54.01,21.9) ; v1(52.32,21.03) 51.65,21.03 51.21,20.59 51.21,20.59 50.88,20.25 U22.21
  Bottom Layer w0.254: v1(54.01,21.9) 53.15,21.03 v1(52.32,21.03)
BAT_A: length 8.8
  Top Layer w0.254: F1.2 26.54,9.83 27.56,8.81 27.56,7.63 CN12.2 27.59,7.6 U4.1
BAT_ADC: length 26.9
  Top Layer w0.254: BAT_TEST.1 v1(74.93,33.2) 75.37,33.64 75.37,34.59 75.32,34.65 R41.2 R39.1 ; v1(59.31,34.85) 59.31,35.86 60.41,36.97 U19.18
  Inner2 w0.254: v1(59.31,34.85) 60.96,33.2 v1(74.93,33.2)
BAT_B: length 9.1
  Top Layer w0.254: F2.2 30.48,9.96 28.82,8.3 CN12.1 28.84,7.6 U4.2
DRDY: length 16.8
  Top Layer w0.254: R75.2 56.69,24.64 v1(52.83,28.5) ; U19.3 52.91,36.84 v1(52.82,36.75)
  Bottom Layer w0.254: v1(52.83,28.5) 52.82,28.51 v1(52.82,36.75)
I2C2_SCL: length 51.6
  Top Layer w0.254: U3.2 67.94,8.18 R76.1 67.81,17.7 v1(67.82,17.7) ; v1(68.83,26.21) 68.83,27.99 69.09,28.25 69.09,49.58 68.02,50.65 U19.47
  Bottom Layer w0.254: v1(68.83,26.21) 67.82,25.2 v1(67.82,17.7)
I2C2_SDA: length 51.8
  Top Layer w0.254: U19.48 68.03,51.15 69.47,49.71 v1(69.47,27.1) ; v1(69.47,24.44) 69.47,8.31 R77.1 69.48,6.66 69.22,6.4 69.22,2.62 U3.1
  Bottom Layer w0.254: v1(69.47,27.1) v1(69.47,24.44)
IMU_I2C1_SCL: length 11
  Top Layer w0.254: U22.23 50.06,19.93 50.06,22.76 49.78,23.05 R43.2 47.63,23.05 46.35,21.76 R54.1
IMU_I2C1_SDA: length 9.6
  Top Layer w0.254: v1(51.12,21.96) 51.18,22.02 R44.2 ; v1(49.28,20.88) 49.68,20.48 U22.24 ; v1(46.74,18.97) 46.49,18.73 R53.1
  Bottom Layer w0.254: v1(51.12,21.96) 50.36,21.96 v1(49.28,20.88) 48.64,20.88 v1(46.74,18.97)
KEY: length 19
  Top Layer w0.254: D7.2 56.51,93.43 56.51,94.16 55.18,95.49 53.25,95.49 U20.4 53.21,95.4 53.21,90.99 R12.1 R11.1
LED_R: length 10.4
  Top Layer w0.254: 87.88,85.62 87.88,89.58 87.89,89.59 87.89,90.59 86.41,92.07 CN3.1
LED_RIGHT: length 49.4
  Top Layer w0.254: v1(83.57,58.98) 83.57,58.34 v1(77.86,52.64) ; v1(74.29,49.07) v1(76.23,51) ; v1(84.07,70.66) 85.34,70.66 89.03,74.35 89.03,75.91 C3.2 89.16,76.04 Q2.1 90.28,79.75 LED_RIGHT.1 ; v1(83.57,63.81) v1(83.57,67.36) ; U19.35 v1(68.07,44.65)
  Bottom Layer w0.254: v1(76.23,51) v1(77.86,52.64) ; v1(83.57,58.98) v1(83.57,63.81) ; v1(84.07,70.66) 83.57,70.16 v1(83.57,67.36) ; v1(68.07,44.65) 69.87,44.65 v1(74.29,49.07)
MOTO1_PWM_TIM3_CH1: length 36
  Top Layer w0.254: v1(73.66,42.67) 76.91,42.67 v1(76.96,42.72) ; v1(67.82,42.72) 67.75,42.65 U19.31 ; v1(81.66,42.72) 87.38,42.72 95.19,34.91 C146.2
  Bottom Layer w0.254: v1(81.66,42.72) v1(76.96,42.72) ; v1(67.82,42.72) 67.87,42.67 v1(73.66,42.67)
MOTO2_PWM_TIM1_CH1: length 50.6
  Top Layer w0.254: C148.2 95.06,51.42 85.98,60.5 59.18,60.5 55.88,57.2 55.88,53.73 U19.67
MOTO3_PWM_TIM2_CH1: length 48.8
  Top Layer w0.254: v1(77.72,42.09) v1(74.29,42.09) ; v1(81.03,42.09) 92.96,30.15 92.96,22.53 95.63,19.86 C145.2 ; U19.30 65.53,42.09 v1(68.45,42.09)
  Bottom Layer w0.254: v1(74.29,42.09) 71.12,42.09 71.09,42.07 70.63,42.07 70.61,42.09 v1(68.45,42.09) ; v1(81.03,42.09) v1(77.72,42.09)
MOTO4_PWM_TIM1_CH3: length 58
  Top Layer w0.254: C149.2 96.46,79.36 95.88,78.79 93.6,78.79 91.95,77.14 91.95,73.58 88.26,69.9 66.8,69.9 54.91,58.01 U19.69
MOTO5_PWM_TIM1_CH2: length 47.5
  Top Layer w0.254: C147.2 95.31,62.98 94.74,62.41 60.07,62.41 55.37,57.71 55.37,53.74 U19.68
MOTO+: length 5.5
  Top Layer w0.254: 77.85,21.14 77.09,21.9 72.64,21.9
MOTO-: length 5.7
  Top Layer w0.254: 89.03,19.87 88,19.87 86.74,21.14 83.82,21.14
MOTO_LEFT: length 43.2
  Top Layer w0.254: 74.74,28.87 72.64,28.87 72.64,28.88 72.64,56.7 71.25,58.09 65.28,58.09 62.91,55.72 U19.53
MOTO_RIGHT: length 46.6
  Top Layer w0.254: U19.52 63.37,53.74 63.37,55.3 65.66,57.58 70.49,57.58 71.88,56.19 v1(71.88,55.68) ; v1(73.28,55.68) 79.38,49.58 79.38,41.45 86.93,33.9 86.93,31.68 88.26,31.68 88.77,31.17 88.77,30.03 88.91,29.9
  Bottom Layer w0.254: v1(73.28,55.68) v1(71.88,55.68)
NRST: length 27.9
  Top Layer w0.254: v1(58.42,40.56) 58.42,38.61 U19.14 ; v1(57.28,62.92) 54.48,62.92 H1.1
  Bottom Layer w0.254: v1(57.28,62.92) 57.28,41.71 v1(58.42,40.56)
OTG_FS_DM: length 36.4
  Top Layer w0.254: U19.70 54.41,58.16 52.96,59.61 R65.1
OTG_FS_DP: length 34.9
  Top Layer w0.254: U19.71 53.91,57.26 52.96,58.22 23.36,58.22 R66.1
PC10_UART4_TX: length 16.2
  Top Layer w0.254: R1.1 37.85,44.89 37.85,46.66 42.34,51.15 U19.78
PC11_UART4_RX: length 28.5
  Top Layer w0.254: v1(38.1,48.44) R8.1 32.94,48.24 32.56,48.24 32.39,48.06 32.39,41.71 33.16,40.93 U1.1 ; U19.79 42.73,50.65 v1(40.51,48.44)
  Bottom Layer w0.254: v1(40.51,48.44) v1(38.1,48.44)
PD5_UART2_TX_BAT: length 28.6
  Top Layer w0.254: U19.86 46.08,47.15 43.56,44.63 43.56,40.18 40.39,37.01 32,37.01 30.73,35.74 R68.1
PD6_UART2_RX_BAT: length 30.5
  Top Layer w0.254: U19.87 46.47,46.65 44.2,44.37 44.2,39.93 35.69,31.42 32.89,31.42 32.52,31.05 R2.1 30.31,29.77 U24.1
RSTN: length 17.8
  Top Layer w0.254: v1(53.97,28.63) 54.86,28.63 58.42,25.07 58.42,23.5 R74.2 ; v1(53.59,36.25) 53.41,36.43 U19.4
  Bottom Layer w0.254: v1(53.59,36.25) 53.59,29.01 v1(53.97,28.63)
SENSOR_A: length 32.7
  Top Layer w0.254: v1(13.59,41.45) 13.59,39.67 13.18,39.26 U9.1 U8.1 U7.1 ; v1(14.99,42.09) 14.99,43.74 15.61,44.36 F3.2 16.28,47.14 14.22,49.2 12.44,49.2 U11.1 U10.1 U5.1
  Bottom Layer w0.254: v1(14.99,42.09) 14.22,42.09 v1(13.59,41.45)
SENSOR_B: length 32.8
  Top Layer w0.254: U5.2 U10.2 U11.2 13.46,47.92 14.35,47.03 14.35,41.07 14.99,40.44 16.4,40.44 F4.2 16.12,40.43 13.71,38.01 U9.2 U8.2 U7.2
SWCLK: length 12.9
  Top Layer w0.254: H1.3 v1(49.15,60.25) ; v1(48.39,52.88) 49.12,52.15 U19.76
  Bottom Layer w0.254: v1(49.15,60.25) 49.15,53.64 v1(48.39,52.88)
SWDIO: length 15
  Top Layer w0.254: U19.72 53.41,56.62 v1(52.83,57.2)
  Bottom Layer w0.254: H1.4 46.61,61.52 47.12,61.01 51.82,61.01 52.83,60 v1(52.83,57.2)
USB3_D+: length 8.5
  Top Layer w0.254: USB1.6 9.76,58.72 ; 9.76,58.72 9.76,58.07 9.41,57.72 USB1.8 ; 9.76,58.72 11.69,58.72 12.45,57.96 R63.2
USB3_D-: length 10.2
  Top Layer w0.254: R64.1 12.7,59.74 12.18,59.22 USB1.5 6.59,59.22 6.35,58.98 6.35,58.47 6.6,58.22 USB1.7
W1:
  vias: v1(129.41,79.25) v1(129.41,77.57)
W2:
  vias: v1(129.33,47.37) v1(129.33,45.76)
W3:
  vias: v1(129.4,13.46) v1(129.4,11.85)
W4:
  vias: v1(129.38,62.86) v1(129.38,61.25)
W5:
  vias: v1(129.36,30.35) v1(129.36,28.74)
Y1:
  vias: v1(129.41,86.92) v1(129.41,85.15)
Y2:
  vias: v1(129.38,55.18) v1(129.38,53.57)
Y3:
  vias: v1(129.38,21.27) v1(129.38,19.66)
Y4:
  vias: v1(129.41,70.79) v1(129.41,69.18)
Y5:
  vias: v1(129.36,38.16) v1(129.36,36.55)
$3N697: length 14.1
  Top Layer w0.254: C107.1 48.37,32.2 X2.2 48.35,33.54 50.42,35.61 54.1,35.61 55.41,36.92 U19.8
$3N698: length 12.4
  Top Layer w0.254: U19.9 55.91,36.53 54.48,35.1 52.32,35.1 50.9,33.68 50.9,32.22 51.03,32.08 C108.1
$3N900: length 9.1
  Top Layer w0.254: U19.12 57.41,35.24 55.14,32.96 X3.3 55.12,32.52 C109.2
$3N913: length 11.2
  Top Layer w0.254: X3.1 58.74,30.34 59.04,30.64 C110.2 58.99,31.17 58.29,31.17 57.91,31.55 U19.13
$3N1102: length 3.3
  Top Layer w0.254: R18.2 48.26,42.35 49.07,43.15 U19.94
$3N27755: length 9.9
  Top Layer w0.254: R38.2 61.13,28.96 C142.1 C141.1 61.09,32.63 61.09,34.21 61.41,34.54 U19.20
$3N37466: length 2.6
  Top Layer w0.254: R40.2 U19.37
$3N37958: length 24.7
  Top Layer w0.254: U19.93 48.81,43.65 47.12,41.96 47.12,26.72 47.75,26.09 50.55,26.09 51.18,25.45 R44.1
$3N37962: length 24.8
  Top Layer w0.254: U19.92 48.55,44.15 46.48,42.09 46.48,25.07 46.99,24.56 49.27,24.56 R43.1
$3N43765: length 4.9
  Top Layer w0.254: C166.1 51.82,57.07 52.91,55.98 U19.73
$3N43824: length 3.9
  Top Layer w0.254: U19.49 65.49,51.67 C167.1
$4N5491: length 1.9
  Top Layer w0.254: D18.6 15.44,57.88 R63.1
$4N5566: length 1.8
  Top Layer w0.254: D18.4 15.4,59.78 R64.2
$4N5769: length 3.8
  Top Layer w0.254: D18.1 21.52,57.88 R66.2 R67.1
$4N5773: length 2.2
  Top Layer w0.254: D18.3 21.43,59.78 R65.2
$4N5919: length 2.1
  Top Layer w0.254: USB1.10 8.12,56.69 R14.2
$4N5920: length 2.2
  Top Layer w0.254: R15.2 10.04,60 9.4,60 9.12,59.72 USB1.4
$5N582: length 7.5
  Top Layer w0.254: R70.2 32.39,32.94 Q1.3 29.85,32.28 29,31.42 U24.2 U24.3
$5N1333: length 16.8
  Top Layer w0.254: U24.7 29,22.2 R73.2 29.36,21.9 R71.1 31.25,18.42 D21.2 30.91,14.63 F2.1 34.8,14.2 D19.1
$5N1784: length 16.7
  Top Layer w0.254: 26.51,14.2 25.65,15.06 25.65,18.01 D21.1 26.03,18.38 R72.1 27.79,21.9 R73.1 27.82,24.18 U24.6 ; 26.51,14.2 F1.1 ; 26.51,14.2 D20.1
$5N3154: length 15.5
  Top Layer w0.254: U25.1 3.53,93.27 3.53,93.74 3.07,94.2 3.07,95.8 3.53,96.26 U25.1 4.12,96.85 4.2,96.93 6.39,96.93 U25.1 6.53,96.2 6.93,95.8 6.93,93.62 U25.1 4.95,91.64 C169.2
$5N3161: length 16.4
  Top Layer w0.254: C170.2 8.32,5 U26.1 6.53,6.2 6.93,5.8 6.93,4.2 6.53,3.8 6.53,3.22 6.47,3.15 5.88,3.15 5.8,3.07 4.2,3.07 4.12,3.15 3.53,3.15 U26.1 3.47,3.8 3.07,4.2 3.07,5.8 3.47,6.2 3.47,6.78 3.53,6.85
$5N3166: length 16
  Top Layer w0.254: 138.47,6.66 138.47,6.2 138.07,5.8 138.07,4.2 138.47,3.8 U27.1 138.52,3.15 139.12,3.15 139.2,3.07 140.8,3.07 140.88,3.15 U27.1 141.53,3.22 141.53,3.8 141.93,4.2 141.93,5.8 141.53,6.2 U27.1 ; C171.2 136.95,5.26 U27.1
$5N6846: length 3.9
  Top Layer w0.254: R68.2 27.57,33.91 Q1.1 27.49,33.95 R69.2
$5N6850: length 16.3
  Top Layer w0.254: U28.1 141.93,93.62 141.93,95.8 141.53,96.2 U28.1 140.94,96.79 140.8,96.93 139.2,96.93 139.06,96.79 138.59,96.79 U28.1 138.53,96.26 138.07,95.8 138.07,94.2 138.53,93.74 138.53,93.27 U28.1 136.89,94.79 C1.2
$5N6855: length 16.3
  Top Layer w0.254: U1.6 27.17,43.47 R7.1 27.18,43.57 R6.1 25.78,45.39 25.27,44.88 23.26,44.88 23.22,44.92 ; D4.1 23.29,45 23.22,44.92 ; F3.1 22.66,44.36 23.22,44.92
$5N6860: length 16.2
  Top Layer w0.254: D3.1 23.22,35.94 D5.2 ; 27.18,41.97 27.18,41.96 27.94,41.96 28.18,42.2 U1.7 ; 27.18,41.97 R5.1 25.51,40.29 25.02,39.8 23.28,39.8 D5.2 ; 27.18,41.97 R7.2 ; D5.2 22.53,40.43 F4.1
$5N6865: length 8.1
  Top Layer w0.254: R3.2 39.38,39.69 39.38,41.27 39.44,41.33 40.77,41.33 41.02,41.58 41.02,44.25 40.39,44.88 R1.2
$5N6867: length 8.2
  Top Layer w0.254: Q4.3 37.07,42.2 U1.2 U1.3 33.54,43.47 33.11,43.9 R4.2
$5N6961: length 6.8
  Top Layer w0.254: Q2.3 86.86,83.57 ; 86.86,83.57 86.75,83.46 R10.1 83.08,83.46 R9.1 ; 86.86,83.57 Q3.1
$6N447: length 3.1
  Top Layer w0.254: U22.10 50.88,16.36 52.11,15.12 52.11,14.47
$6N1099: length 2.3
  Top Layer w0.254: U23.10 58.75,18.21 C163.2
$6N2109: length 4.6
  Top Layer w0.254: 58.47,21.94 58.47,21.31 57.78,20.62 55.75,20.62 55.5,20.37 55.5,19.73 U23.14
$6N2149: length 3.2
  Top Layer w0.254: U23.15 55,20.77 56.13,21.9 56.64,21.9 56.69,21.94
$6N2757: length 13.2
  Top Layer w0.254: 89.03,24.68 90.93,24.68 90.93,25.32 90.42,25.83 90.42,26.46 90.42,26.47 v1(91.57,26.47) ; 85.98,29.38 86.1,29.26 v1(87.12,29.26)
  Bottom Layer w0.254: v1(91.57,26.47) 87.63,26.47 87.12,26.97 v1(87.12,29.26)
$6N2777: length 11.6
  Top Layer w0.254: 88.91,26.47 88.91,28.12 82.68,28.12 81.91,27.36 81.91,24.69
$6N2778: length 5.6
  Top Layer w0.254: 75.95,24.69 75.95,25.2 75.69,25.45 72.64,25.45 72.64,27.1
$6N2780: length 11.1
  Top Layer w0.254: 88.12,15.65 90.02,15.65 90.68,16.31 90.68,20.88 90.17,21.39 89.04,21.39 89.03,21.38 89.03,23.17
$6N2781: length 13.9
  Top Layer w0.254: 73.87,11.77 72.35,11.77 71.12,13 71.12,21.89 71.13,21.9 71.13,23.67
$6N2786: length 18.8
  Top Layer w0.254: v1(73.79,26.09) 75.69,27.99 75.69,31.17 ; v1(73.79,23.67) 72.64,23.67 ; v1(70.1,25.45) 71.13,25.45 ; 72.77,20.11 73.4,20.11 v1(73.79,20.5)
  Bottom Layer w0.254: v1(70.1,25.45) 70.74,26.09 v1(73.79,26.09) v1(73.79,23.67) v1(73.79,20.5)
$9N4816: length 2.1
  Top Layer w0.254: LED2.1 39.02,67.74 R16.2
$9N50400: length 12.7
  Top Layer w0.254: Q8.4 45.85,79.05 46.1,79.3 46.1,84.3 47.12,85.32 48.55,85.32 D8.1 48.64,86.41 49.4,87.17 50.9,87.17 50.92,87.19
$9N50406:
  vias: v1(28.11,90) v1(28.45,85.27) v1(29.97,90) v1(31.24,87.55) v1(34.54,86.54) v1(34.54,84.76) v1(34.54,81.46) v1(34.54,79.55)
$9N50407:
  vias: v1(13.14,87.94) v1(13.59,90.22) v1(14.1,85.27) v1(17.19,84.1) v1(20.7,90.09) v1(20.73,87.94) v1(20.83,85.27) v1(23.7,90.48) v1(23.7,85.11)
$9N50408: length 1.9
  Top Layer w0.254: C177.2 28.01,92.7 R83.1
$9N50410: length 5
  Top Layer w0.254: 57.66,70.6 55.81,70.6 R22.2 55.25,70.65 54.23,71.68 53.14,71.68
$9N50412: length 4.7
  Top Layer w0.254: U12.3 54.36,72.95 54.74,72.57 55.74,72.57 R23.1 57.6,72.58 C15.1
$9N50413: length 2.7
  Top Layer w0.254: R23.2 55.62,74.22 U12.4
$9N50415: length 2.5
  Top Layer w0.254: C16.2 45.28,71.68 47.7,71.68
$9N50420: length 5.3
  Top Layer w0.254: R24.1 54.23,67.36 53.14,68.45 U12.1

## Copper pours and planes (outline as drawn; the poured copper is in the pictures)
3V3 on Top Layer: 39.3,66.61 39.75,66.16 39.75,63.55 39.37,63.17 31.02,63.17 30.64,63.55 30.64,66.32 30.94,66.61
3V3 on Inner2: 30.65,65.51 30.64,65.52 30.64,66.32 30.94,66.62 30.95,66.6 39.32,66.6 39.75,66.16 39.75,63.55 39.37,63.17 37.34,63.17 35.56,61.39 35.56,27.36 40.26,22.66 62.23,22.66 62.87,22.02 62.87,20.37 62.23,19.74 36.68,19.74 30.65,25.76
3V3 on Inner2: 39.3,66.61 39.75,66.16 39.75,63.55 39.37,63.17 31.02,63.17 30.64,63.55 30.64,66.32 30.94,66.61
3V3_MCU on Top Layer: 64.26,29.68 67.74,29.68 67.74,26.17 64.26,26.17
5V0 on Top Layer: 4.09,33.53 7.09,33.53 7.09,32.11 4.09,32.11
5V0 on Top Layer: 4.1,43.25 7.09,43.25 7.09,42.14 4.1,42.14
5V0 on Top Layer: 37.72,75.31 37.72,70.92 37.08,70.28 3.68,70.28 3.56,70.41 3.56,73.58 3.69,73.72 17.84,73.72 18.81,74.69 18.81,77.67 17.68,78.79 3.56,78.79 3.43,78.92 3.43,82.09 3.68,82.35 21.97,82.35 28.07,76.25 36.78,76.25
5V0 on Inner2: 37.72,75.31 37.72,70.92 37.08,70.28 3.68,70.28 3.56,70.41 3.56,73.58 3.69,73.72 17.84,73.72 18.81,74.69 18.81,77.67 17.68,78.79 3.56,78.79 3.43,78.92 3.43,82.09 3.68,82.35 21.97,82.35 28.07,76.25 36.78,76.25
5V0 on Inner2: 37.72,75.31 37.72,70.92 37.08,70.28 3.68,70.28 3.56,70.41 3.56,73.58 3.69,73.72 17.84,73.72 18.81,74.69 18.81,77.67 17.68,78.79 3.56,78.79 3.43,78.92 3.43,82.09 3.68,82.35 21.97,82.35 28.07,76.25 36.78,76.25
12V0 on Top Layer: 94.36,29.26 102.44,29.26 102.44,26.48 94.36,26.48
12V0 on Top Layer: 94.52,77.81 102.44,77.81 102.44,74.95 94.52,74.95
12V0 on Top Layer: 72.39,15.93 74.42,15.93 74.42,12.74 72.4,12.74 72.26,12.88 72.26,15.8
12V0 on Top Layer: 94.62,61.9 102.34,61.9 102.34,59 94.62,59
12V0 on Top Layer: 97.71,46.1 102.44,46.1 102.44,43.25 97.71,43.25
12V0 on Top Layer: 88.84,96.87 92.01,96.87 92.01,86.88 88.84,86.88
12V0 on Top Layer: 87.71,14.68 90.27,14.68 90.68,14.28 90.68,11.86 90.3,11.48 87.63,11.48 87.38,11.74 87.38,14.4 87.63,14.66 87.69,14.66
12V0 on Top Layer: 58.29,89.59 67.18,89.59 67.44,89.33 67.44,79.3 66.68,78.54 46.86,78.54 46.74,78.66 46.74,83.16 46.82,83.24 51.94,83.24
12V0 on Top Layer: 97.59,12.58 102.35,12.58 102.35,9.72 97.59,9.72
12V0 on Top Layer: 97.67,29.34 102.44,29.34 102.44,26.48 97.67,26.48
12V0 on Top Layer: 94.62,46.13 102.44,46.13 102.44,43.25 94.62,43.25
12V0 on Top Layer: 97.58,61.85 102.34,61.85 102.34,59 97.58,59
12V0 on Top Layer: 94.36,12.62 102.35,12.62 102.35,9.72 94.36,9.72
12V0 on Top Layer: 46.89,70.95 46.92,70.92 48.64,70.92 49.78,69.77 49.78,69.65 49.4,69.27 46.91,69.27 46.61,69.57 46.61,70.66
12V0 on Inner2: 46.86,82.47 46.85,82.48 46.85,83.24 52.07,83.24 58.29,89.46 77.98,89.46 78.64,90.12 78.64,96.83 94.23,96.83 94.62,96.44 94.62,78.28 95.12,77.78 102.49,77.78 102.57,77.69 102.57,74.98 94.87,74.98 94.68,74.79 94.68,62.41 95.19,61.9 102.36,61.9 102.47,61.79 102.47,59 94.74,59 94.62,58.87 94.62,46.15 94.66,46.1 102.57,46.1 102.57,43.25 95.09,43.25 94.49,42.66 94.49,30.03 95.18,29.34 102.56,29.34 102.56,26.48 95.5,26.48 94.62,25.59 94.62,12.58 102.57,12.58 102.57,9.7 72.32,9.7 72.32,66.85 57.17,66.85 56.9,67.13 56.9,68.02 55.78,69.14 47.24,69.14 46.86,69.52
12V0_IN on Top Layer: 37.72,87.05 37.72,87.05 37.72,87.32 38.05,87.65 46.75,87.65 47.06,87.34 47.06,86.09 45.59,84.62 45.59,80.06 45.41,79.88 44.56,79.88 43.19,78.51 38.23,78.51 37.72,79.01
12V0_IN on Inner2: 37.72,87.05 37.72,87.05 37.72,87.32 38.05,87.65 46.75,87.65 47.06,87.34 47.06,86.09 45.59,84.62 45.59,80.06 45.41,79.88 44.56,79.88 43.19,78.51 38.23,78.51 37.72,79.01
GND on Top Layer: 99.78,52.08 102.43,52.08 102.43,50.73 99.78,50.73
GND on Top Layer: 99.66,18.56 102.44,18.56 102.44,17.2 99.66,17.2
GND on Top Layer: 0,68.38 0,95.62 4.38,100 129.97,100 131.7,98.27 131.7,90.73 129.92,88.95 102.49,88.95 102.36,88.82 102.36,9.7 102.49,9.58 130.05,9.58 131.57,8.05 131.57,1.57 130,0 73.03,0 73.03,67.74 73.02,67.74 0.64,67.74
GND on Top Layer: 97.64,40.42 102.41,40.42 102.41,37.56 97.64,37.56
GND on Top Layer: 97.66,88.89 102.43,88.89 102.43,86.03 97.66,86.03
GND on Top Layer: 99.75,35.32 102.39,35.32 102.39,33.97 99.75,33.97
GND on Top Layer: 97.56,23.66 102.32,23.66 102.32,20.8 97.56,20.8
GND on Top Layer: -0.13,68.38 -0.13,95.62 4.25,100 129.84,100 131.57,98.27 131.57,90.73 129.79,88.95 102.36,88.95 102.24,88.82 102.24,9.7 102.36,9.58 129.92,9.58 131.44,8.05 131.44,1.57 129.87,0 72.9,0 72.9,67.74 72.9,67.74 0.51,67.74
GND on Top Layer: 0.13,66.02 71.2,66.02 71.2,0.13 0.13,0.13
GND on Bottom Layer: 0,68.38 0,95.62 4.38,100 129.97,100 131.7,98.27 131.7,90.73 129.92,88.95 102.49,88.95 102.36,88.82 102.36,9.7 102.49,9.58 130.05,9.58 131.57,8.05 131.57,1.57 130,0 73.03,0 73.03,67.74 73.02,67.74 0.64,67.74
GND on Bottom Layer: 0.13,66.02 71.2,66.02 71.2,0.13 0.13,0.13
GND on Inner1: -0.13,66.02 70.95,66.02 70.95,0.13 -0.13,0.13
GND on Inner1: 0,68.38 0,95.62 4.38,100 129.97,100 131.7,98.27 131.7,90.73 129.92,88.95 102.49,88.95 102.36,88.82 102.36,9.7 102.49,9.58 130.05,9.58 131.57,8.05 131.57,1.57 130,0 73.03,0 73.03,67.74 73.02,67.74 0.64,67.74
V1 on Top Layer: 125.42,83.81 142.32,83.81 142.32,80.63 125.42,80.63
V1 on Inner1: 125.42,83.81 142.32,83.81 142.32,80.63 125.42,80.63
V1 on Inner2: 125.42,83.81 142.32,83.81 142.32,80.63 125.42,80.63
V2 on Top Layer: 124.65,52.18 141.54,52.18 141.54,49.01 124.65,49.01
V2 on Inner1: 124.65,52.18 141.54,52.18 141.54,49.01 124.65,49.01
V2 on Inner2: 124.65,52.18 141.54,52.18 141.54,49.01 124.65,49.01
V3 on Top Layer: 124.65,18.28 141.54,18.28 141.54,15.1 124.65,15.1
V3 on Inner1: 124.65,18.28 141.54,18.28 141.54,15.1 124.65,15.1
V3 on Inner2: 124.65,18.28 141.54,18.28 141.54,15.1 124.65,15.1
V4 on Top Layer: 124.9,67.68 141.8,67.68 141.8,64.5 124.9,64.5
V4 on Inner1: 124.9,67.68 141.8,67.68 141.8,64.5 124.9,64.5
V4 on Inner2: 124.9,67.68 141.8,67.68 141.8,64.5 124.9,64.5
V5 on Top Layer: 124.78,35.17 141.67,35.17 141.67,31.99 124.78,31.99
V5 on Inner1: 124.78,35.17 141.67,35.17 141.67,31.99 124.78,31.99
V5 on Inner2: 124.78,35.17 141.67,35.17 141.67,31.99 124.78,31.99
VDDA on Top Layer: 62.11,30.27 62.11,33.21 62.23,33.32 64.9,33.32 65.53,32.69 65.53,30.36 65.31,30.15 62.23,30.15
MOTO1_PWM_TIM3_CH1 on Top Layer: 94.87,32.56 102.45,32.56 102.45,31.21 94.87,31.21
